# Altium project ESP32-S3_6-Channel_Relay_Controller.PrjPcb
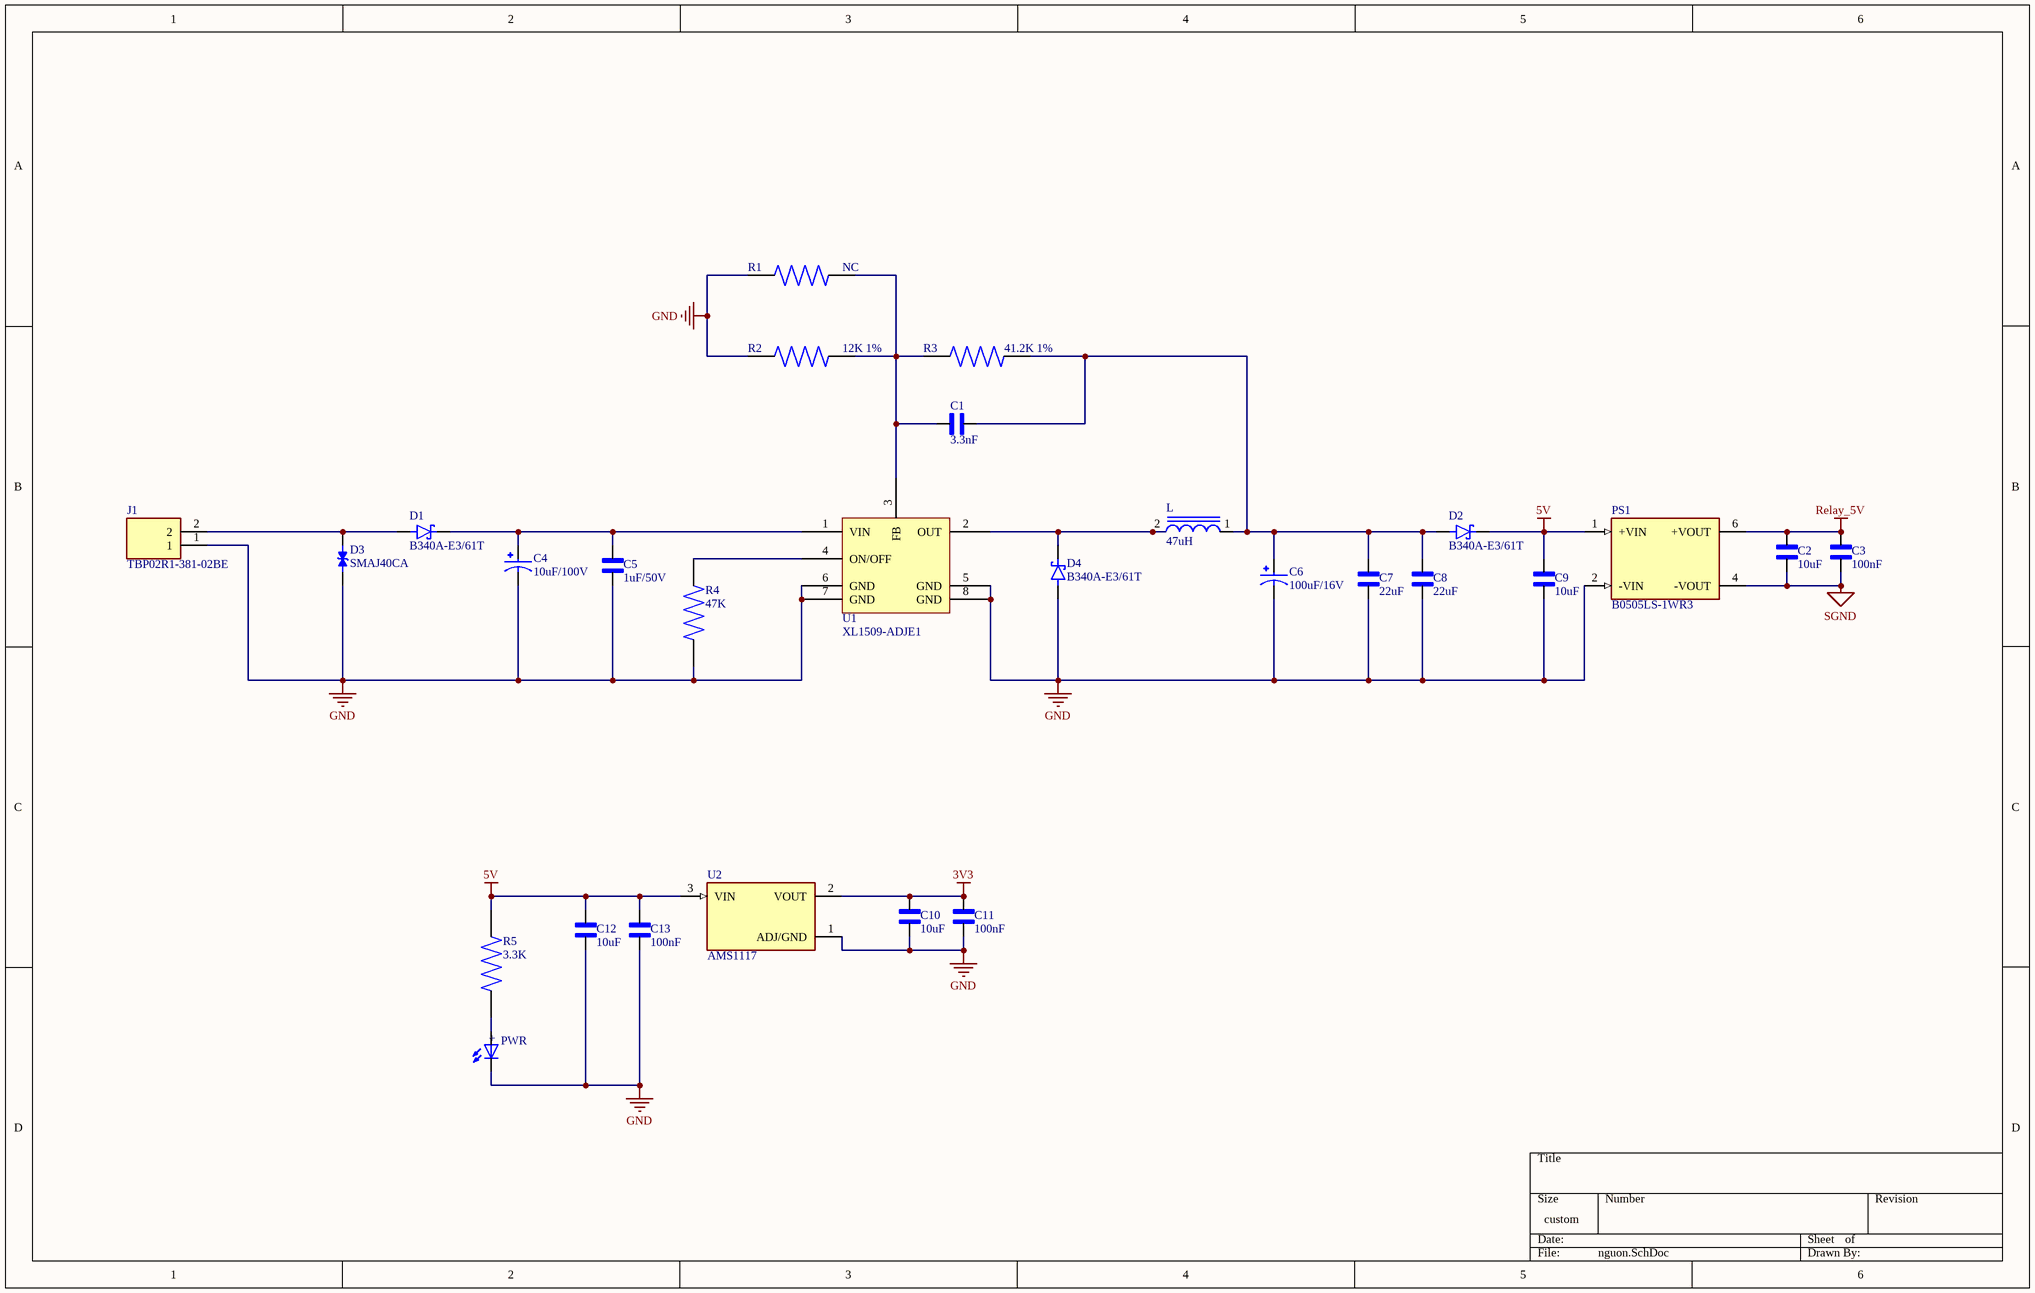
[diagram p0: nguon.SchDoc]
5 sheets, 173 parts. Net scope: global (net labels, ports and power ports of the same name join across sheets).
Board file: esp32s3.PcbDoc
Sheets:
  nguon.SchDoc
  vi_dieu_khien.SchDoc
  RS_485.SchDoc
  Relay.SchDoc
  LoRa.SchDoc

## Sheet nguon.SchDoc
size 381 x 241 mm; SheetNumber: 1; SheetTotal: 5

### Parts
C1  3.3nF  [CAPC1608X94N]
C2  10uF  [CAPC1608X94N]
C3  100nF  [CAPC1608X94N]
C4  10uF/100V  [CAP_EEEFN2A100P]
C5  1uF/50V  [CAPC1608X94N]
C6  100uF/16V  [CAP_EEETC1C101XV]
C7  22uF  [CAPC1608X94N]
C8  22uF  [CAPC1608X94N]
C9  10uF  [CAPC1608X94N]
C10  10uF  [CAPC1608X94N]
C11  100nF  [CAPC1608X94N]
C12  10uF  [CAPC1608X94N]
C13  100nF  [CAPC1608X94N]
D1  B340A-E3/61T  [DIOM5126X229N]
D2  B340A-E3/61T  [DIOM5126X229N]
D3  SMAJ40CA  [DIOM4325X250N]
D4  B340A-E3/61T  [DIOM5126X229N]
J1  TBP02R1-381-02BE  [CUI_TBP02R1-381-02BE]
L  47uH  [Introdutor_47uH_12x12x7]
PS1  B0505LS-1WR3  [CONV_RFB-0505S]
PWR  WL-SMCW_1206  [WL-SMCW_1206]  (value not drawn)
R1  NC  [RES_ERJU03J474V]
R2  12K 1%  [RES_ERJU03J474V]
R3  41.2K 1%  [RES_ERJU03J474V]
R4  47K  [RES_ERJU03J474V]
R5  3.3K  [RES_ERJU03J474V]
U1  XL1509-ADJE1  [SOIC127P599X175-8N]
U2  AMS1117  [SOT229P700X180-4N]

### Nets
3V3: C10.2 C11.2 U2.2(VOUT)
5V: C9.2 C12.2 C13.2 D2.C PS1.1(+VIN) R5.2 U2.3(VIN)
GND: C4.2 C5.1 C6.2 C7.1 C8.1 C9.1 C10.1 C11.1 C12.1 C13.1 D3.1 D4.A J1.1 PS1.2(-VIN) PWR.1(NEG) R1.2 R2.2 R4.1 U1.5(GND) U1.6(GND) U1.7(GND) U1.8(GND) U2.1(ADJ/GND)
Relay_5V: C2.2 C3.2 PS1.6(+VOUT)
SGND: C2.1 C3.1 PS1.4(-VOUT)
NetC1_1: C1.1 C6.1 C7.2 C8.2 D2.A L.1 R3.1
NetC1_2: C1.2 R1.1 R2.1 R3.2 U1.3(FB)
NetC4_1: C4.1 C5.2 D1.C U1.1(VIN)
NetD1_A: D1.A D3.2 J1.2
NetD4_C: D4.C L.2 U1.2(OUT)
NetPWR_2: PWR.2(POS) R5.1
NetR4_2: R4.2 U1.4(ON/OFF)

### Notes on the sheet
- (in symbol WL-SMCW_1206) +

### Library data of the parts
C1-C3 C5 C7-C13 = cap_0603_VJ0603D3R9DXCAP: cap 0603 (1608 Metric); MF: Vishay Vitramon; SnapEDA_Link: https://www.snapeda.com/parts/VJ0603D3R9DXCAP/Vishay/view-part/?ref=snap; Package: 1608 Vishay Vitramon; Value: *; MP: VJ0603D3R9DXCAP; Check_prices: https://www.snapeda.com/parts/VJ0603D3R9DXCAP/Vishay/view-part/?ref=eda
C4 = EEEFN2A100P: CAP ALUM 10UF 20% 100V SMD; MF: Panasonic; SnapEDA_Link: https://www.snapeda.com/parts/EEEFN2A100P/Panasonic/view-part/?ref=snap; Package: RADIAL-2 Panasonic; Value: *; MP: EEEFN2A100P; Check_prices: https://www.snapeda.com/parts/EEEFN2A100P/Panasonic/view-part/?ref=eda
C6 = EEETC1C101XV: CAP ALUM 100UF 20% 16V SMD; MF: Panasonic; Package: RADIAL-2 Panasonic; Price: None; Check_prices: https://www.snapeda.com/parts/EEETC1C101XV/Panasonic/view-part/?ref=eda; Value: *; SnapEDA_Link: https://www.snapeda.com/parts/EEETC1C101XV/Panasonic/view-part/?ref=snap; MP: EEETC1C101XV; Availability: In Stock; Purchase-URL: https://pricing.snapeda.com/search/part/EEETC1C101XV/?ref=eda
D1 D2 D4 = B340A-E3/61T: Diode Schottky 40 V 3A Surface Mount DO-214AC (SMA); MF: Vishay Semiconductor; SnapEDA_Link: https://www.snapeda.com/parts/B340A-E3/61T/Vishay/view-part/?ref=snap; Package: DO-214 Vishay Semiconductor; Value: *; MP: B340A-E3/61T; Check_prices: https://www.snapeda.com/parts/B340A-E3/61T/Vishay/view-part/?ref=eda
D3 = SMAJ40CA: Transient Voltage Suppressor, TVS, Transil SMAJ Series, Bidirectional, 40 V, DO-214AC, 2, 44.4 V; MF: STMicroelectronics; MP: SMAJ40CA-TR; SnapEDA_Link: https://www.snapeda.com/parts/SMAJ40CA-TR/STMicroelectronics/view-part/?ref=snap; Package: DO-214 STMicroelectronics; Value: *; Check_prices: https://www.snapeda.com/parts/SMAJ40CA-TR/STMicroelectronics/view-part/?ref=eda
J1 = TBP02R1-381-02BE: 2~24 Poles, Pluggable,Receptacle, Horizontal, 3.81 Pitch, Terminal Block Connector; MF: Same Sky; SnapEDA_Link: https://www.snapeda.com/parts/TBP02R1-381-02BE/Same+Sky/view-part/?ref=snap; Package: None; Value: *; MP: TBP02R1-381-02BE; Check_prices: https://www.snapeda.com/parts/TBP02R1-381-02BE/Same+Sky/view-part/?ref=eda
L = Introdutor_47uH_12x12x7SRR1260-470M: 47ÂµH Shielded Wirewound Inductor 2.6A 86mOhm Max Nonstandard; MF: Bourns; Value: *; Package: Nonstandard Bourns; Price: None; SnapEDA_Link: https://www.snapeda.com/parts/SRR1260-470M/Bourns/view-part/283129/?ref=snap; Availability: Unavailable; MP: SRR1260-470M
PS1 = B0505LS-1WR3: 1W DC/DC-Converter 'ECONOLINE' SIP7 1kV unreg; MF: Recom Power; MP: RFB-0505S; SnapEDA_Link: https://www.snapeda.com/parts/RFB-0505S/Recom+Power/view-part/?ref=snap; Package: SIP-6 Recom Power; Value: *; Check_prices: https://www.snapeda.com/parts/RFB-0505S/Recom+Power/view-part/?ref=eda
PWR = WL-SMCW_1206: 1206, Blue Typ.(@20mA): 470nm, 145mcd, 3.2V, 140Â° InGaN; MF: Wurth Electronics; MP: 150120BS75000; SnapEDA_Link: https://www.snapeda.com/parts/150120BS75000/Wurth+Electronics/view-part/?ref=snap; Package: 1206 Wurth Electronics; Value: *; Check_prices: https://www.snapeda.com/parts/150120BS75000/Wurth+Electronics/view-part/?ref=eda
R1-R5 = res_0603_ERJU03J474V: 0603 Anti-Sulfurated; MF: Panasonic; SnapEDA_Link: https://www.snapeda.com/parts/ERJU03J474V/Panasonic/view-part/?ref=snap; Package: 1608-2 Panasonic; Value: *; MP: ERJU03J474V; Check_prices: https://www.snapeda.com/parts/ERJU03J474V/Panasonic/view-part/?ref=eda
U1 = XL1509-ADJE1: 2A 150KHz 40V Buck DC to DC Converter; MF: Texas Instruments; MP: LM358DR; SnapEDA_Link: https://www.snapeda.com/parts/LM358DR/Texas+Instruments/view-part/?ref=snap; Package: SOIC-8 Texas Instruments; Value: *; Check_prices: https://www.snapeda.com/parts/LM358DR/Texas+Instruments/view-part/?ref=eda
U2 = AMS1117: 1A LOW DROPOUT VOLTAGE REGULATOR SOT-223; MF: Advanced Monolithic Systems; SnapEDA_Link: https://www.snapeda.com/parts/AMS1117/Advanced+Monolithic+Systems/view-part/?ref=snap; Package: SOT-223 Seeed Technology; Value: *; MP: AMS1117; Check_prices: https://www.snapeda.com/parts/AMS1117/Advanced+Monolithic+Systems/view-part/?ref=eda

## Sheet vi_dieu_khien.SchDoc
size C; SheetNumber: 2; SheetTotal: 5
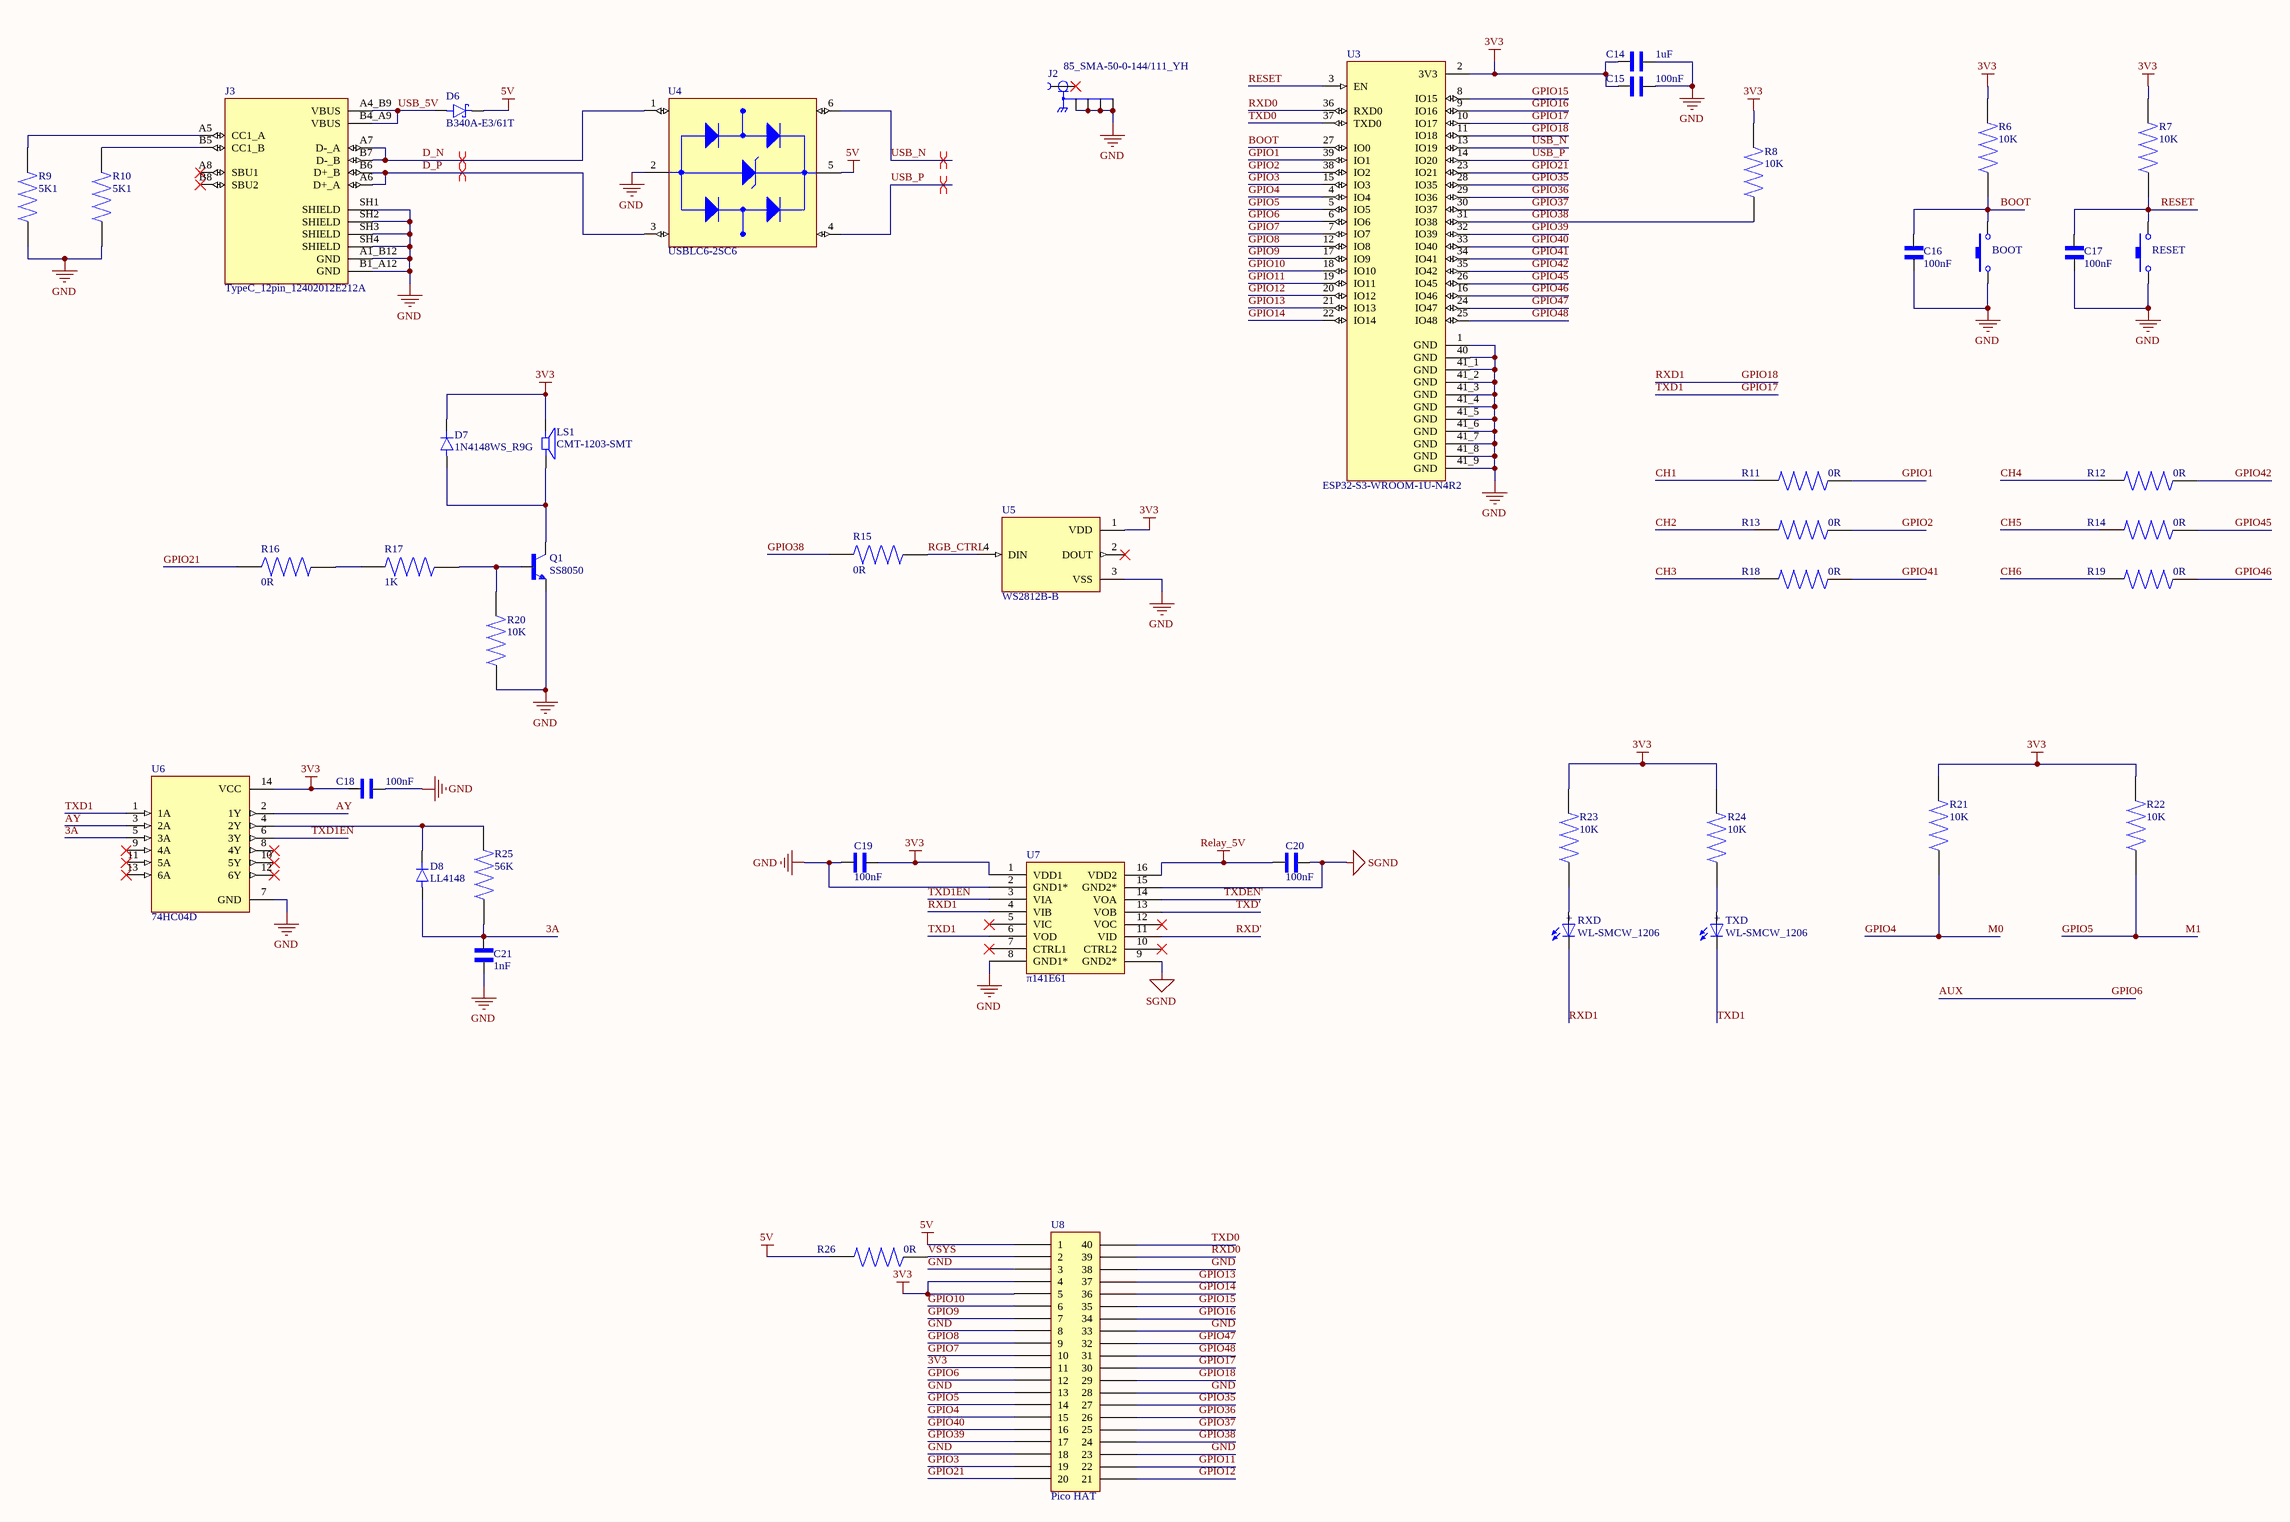
[diagram p1: vi_dieu_khien.SchDoc]

### Parts
BOOT  Nut Nhan 2 Chan SMD 3x6x2.5  [PCBComponent_1]  (value not drawn)
C14  1uF  [CAPC1608X94N]
C15  100nF  [CAPC1608X94N]
C16  100nF  [CAPC1608X94N]
C17  100nF  [CAPC1608X94N]
C18  100nF  [CAPC1608X94N]
C19  100nF  [CAPC1608X94N]
C20  100nF  [CAPC1608X94N]
C21  1nF  [CAPC1608X94N]
D6  B340A-E3/61T  [DIOM5126X229N]
D7  1N4148WS_R9G  [DIO_1N4148WS_R9G]
D8  LL4148  [DIO_LL4148]
J2  85_SMA-50-0-144/111_YH  [HUBER+SUHNER_85_SMA-50-0-144/111_YH]
J3  TypeC_12pin_12402012E212A  [TypeC_12pin_12402012E212A]
LS1  CMT-1203-SMT  [CUI_CMT-1203-SMT]
Q1  SS8050  [SOT-23_BEC]
R6  10K  [RES_ERJU03J474V]
R7  10K  [RES_ERJU03J474V]
R8  10K  [RES_ERJU03J474V]
R9  5K1  [RES_ERJU03J474V]
R10  5K1  [RES_ERJU03J474V]
R11  0R  [RES_ERJU03J474V]
R12  0R  [RES_ERJU03J474V]
R13  0R  [RES_ERJU03J474V]
R14  0R  [RES_ERJU03J474V]
R15  0R  [RES_ERJU03J474V]
R16  0R  [RES_ERJU03J474V]
R17  1K  [RES_ERJU03J474V]
R18  0R  [RES_ERJU03J474V]
R19  0R  [RES_ERJU03J474V]
R20  10K  [RES_ERJU03J474V]
R21  10K  [RES_ERJU03J474V]
R22  10K  [RES_ERJU03J474V]
R23  10K  [RES_ERJU03J474V]
R24  10K  [RES_ERJU03J474V]
R25  56K  [RES_ERJU03J474V]
R26  0R  [RES_ERJU03J474V]
RESET  Nut Nhan 2 Chan SMD 3x6x2.5  [PCBComponent_1]  (value not drawn)
RXD  WL-SMCW_1206  [WL-SMCW_1206]
TXD  WL-SMCW_1206  [WL-SMCW_1206]
U3  ESP32-S3-WROOM-1U-N4R2  [XCVR_ESP32-S3-WROOM-1U-N4R2]
U4  USBLC6-2SC6  [USBLC6-2SC6]
U5  WS2812B-B  [LED_WS2812B-B]
U6  74HC04D  [SOP127P600X170-14N]
U7  π141E61  [SOIC127P1032X265-16N]
U8  Pico HAT  [Pico_HAT]

### Nets
3V3: C14.1 C15.1 C18.1 C19.1 D7.C(K) LS1.1 R6.2 R7.2 R8.2 R21.2 R22.2 R23.2 R24.2 U3.2(3V3) U5.1(VDD) U6.14(VCC) U7.1(VDD1) U8.4 U8.5 U8.11
5V: D6.C R26.2 U4.5(VBUS) U8.1
GND: BOOT.1 C14.2 C15.2 C16.1 C17.1 C18.2 C19.2 C21.1 J2.G1 J2.G2 J2.G3 J2.G4 J3.A1_B12(GND) J3.B1_A12(GND) J3.SH1(SHIELD) J3.SH2(SHIELD) J3.SH3(SHIELD) J3.SH4(SHIELD) Q1.E R9.1 R10.1 R20.1 RESET.1 U3.1(GND) U3.40(GND) U3.41_1(GND) U3.41_2(GND) U3.41_3(GND) U3.41_4(GND) U3.41_5(GND) U3.41_6(GND) U3.41_7(GND) U3.41_8(GND) U3.41_9(GND) U4.2(GND) U5.3(VSS) U6.7(GND) U7.2(GND1*) U7.8(GND1*) U8.3 U8.8 U8.13 U8.18 U8.23 U8.28 U8.33 U8.38
Relay_5V: C20.2 U7.16(VDD2)
SGND: C20.1 U7.9(GND2*) U7.15(GND2*)
3A: C21.2 D8.A R25.1 U6.5(3A)
AUX: U3.6(IO6) U8.12  [also labelled GPIO6]
AY: U6.2(1Y) U6.3(2A)
BOOT: BOOT.2 C16.2 R6.1 U3.27(IO0)
CH1: R11.2
CH2: R13.2
CH3: R18.2
CH4: R12.2
CH5: R14.2
CH6: R19.2
D_N: J3.A7(D-_A) J3.B7(D-_B) U4.1(I/O1_IN)
D_P: J3.A6(D+_A) J3.B6(D+_B) U4.3(I/O2_IN)
GPIO1: R11.1 U3.39(IO1)
GPIO2: R13.1 U3.38(IO2)
GPIO3: U3.15(IO3) U8.19
GPIO4: R21.1 U3.4(IO4) U8.15  [also labelled M0]
GPIO5: R22.1 U3.5(IO5) U8.14  [also labelled M1]
GPIO7: U3.7(IO7) U8.10
GPIO8: U3.12(IO8) U8.9
GPIO9: U3.17(IO9) U8.7
GPIO10: U3.18(IO10) U8.6
GPIO11: U3.19(IO11) U8.22
GPIO12: U3.20(IO12) U8.21
GPIO13: U3.21(IO13) U8.37
GPIO14: U3.22(IO14) U8.36
GPIO15: U3.8(IO15) U8.35
GPIO16: U3.9(IO16) U8.34
GPIO17: TXD.1(NEG) U3.10(IO17) U6.1(1A) U7.6(VOD) U8.30  [also labelled TXD1]
GPIO18: RXD.1(NEG) U3.11(IO18) U7.4(VIB) U8.29  [also labelled RXD1]
GPIO21: R16.1 U3.23(IO21) U8.20
GPIO35: U3.28(IO35) U8.27
GPIO36: U3.29(IO36) U8.26
GPIO37: U3.30(IO37) U8.25
GPIO38: R8.1 R15.1 U3.31(IO38) U8.24
GPIO39: U3.32(IO39) U8.17
GPIO40: U3.33(IO40) U8.16
GPIO41: R18.1 U3.34(IO41)
GPIO42: R12.1 U3.35(IO42)
GPIO45: R14.1 U3.26(IO45)
GPIO46: R19.1 U3.16(IO46)
GPIO47: U3.24(IO47) U8.32
GPIO48: U3.25(IO48) U8.31
RESET: C17.2 R7.1 RESET.2 U3.3(EN)
RGB_CTRL: R15.2 U5.4(DIN)
RXD0: U3.36(RXD0) U8.39
RXD': U7.11(VID)
TXD0: U3.37(TXD0) U8.40
TXD1EN: U6.6(3Y) U7.3(VIA)
TXD': U7.13(VOB)
TXDEN': U7.14(VOA)
USB_5V: D6.A J3.A4_B9(VBUS) J3.B4_A9(VBUS)
USB_N: U3.13(IO19) U4.6(I/O1_OUT)
USB_P: U3.14(IO20) U4.4(I/O2_OUT)
VSYS: R26.1 U8.2
NetD7_A: D7.A LS1.2 Q1.C
NetD8_C: D8.C R25.2 U6.4(2Y)
NetJ3_A5: J3.A5(CC1_A) R9.2
NetJ3_B5: J3.B5(CC1_B) R10.2
NetQ1_B: Q1.B R17.2 R20.2
NetR16_2: R16.2 R17.1
NetR23_1: R23.1 RXD.2(POS)
NetR24_1: R24.1 TXD.2(POS)

Not connected (* = marked no-connect by the designer): J2 1*; J3 A8(SBU1)* B8(SBU2)*; U5 2(DOUT)*; U6 8(4Y)* 9(4A)* 10(5Y)* 11(5A)* 12(6Y)* 13(6A)*; U7 5(VIC)* 7(CTRL1)* 10(CTRL2)* 12(VOC)*

### Layout directives
differential pair: D_N, D_P, USB_N, USB_P

### Notes on the sheet
- (in symbol WL-SMCW_1206) +

### Library data of the parts
BOOT RESET = Nut Nhan 2 Chan SMD 3x6x2.5: Ma_Hang: MH001036; Ten: Nút Nhấn 2 Chân 3x6x2.5MM SMD
C14-C21 = cap_0603_VJ0603D3R9DXCAP: as C1 on sheet nguon; SnapEDA_Link: https://www.snapeda.com/parts/VJ0603D3R9DXCAP/Vishay/view-part/?ref=snap; Package: 1608 Vishay Vitramon; Value: *; MP: VJ0603D3R9DXCAP; Check_prices: https://www.snapeda.com/parts/VJ0603D3R9DXCAP/Vishay/view-part/?ref=eda
D6 = B340A-E3/61T: as D1 on sheet nguon; SnapEDA_Link: https://www.snapeda.com/parts/B340A-E3/61T/Vishay/view-part/?ref=snap; Package: DO-214 Vishay Semiconductor; Value: *; MP: B340A-E3/61T; Check_prices: https://www.snapeda.com/parts/B340A-E3/61T/Vishay/view-part/?ref=eda
D7 = 1N4148WS_R9G: 150mA, 100V High Speed SMD Switching Diode; MF: Taiwan Semiconductor; MP: 1N4148WS R9G; SnapEDA_Link: https://www.snapeda.com/parts/1N4148WS%20R9G/Taiwan+Semiconductor/view-part/?ref=snap; Package: SOD-323F Taiwan Semiconductor; Value: *; Check_prices: https://www.snapeda.com/parts/1N4148WS%20R9G/Taiwan+Semiconductor/view-part/?ref=eda
D8 = LL4148: Small Signal Diode, SOD-80, 100V, 0.15A, 175Â°C; MF: Diotec Semiconductor; SnapEDA_Link: https://www.snapeda.com/parts/LL4148/Diotec/view-part/?ref=snap; Package: SOD-80 Diotec; Value: *; MP: LL4148; Check_prices: https://www.snapeda.com/parts/LL4148/Diotec/view-part/?ref=eda
J2 = 85_SMA-50-0-144/111_YH: RF Connector, SMA Right angle PCB jack(f) | HUBER+SUHNER 85_SMA-50-0-144/111_YH; SnapEDA_Link: https://www.snapeda.com/parts/85_SMA-50-0-144/111_YH/Huber%252BSuhner/view-part/?ref=snap; Package: None; Value: *; MF: HUBER+SUHNER; MP: 85_SMA-50-0-144/111_YH; Check_prices: https://www.snapeda.com/parts/85_SMA-50-0-144/111_YH/Huber%252BSuhner/view-part/?ref=eda
J3 = TypeC_12pin_12402012E212A: USB2.0, Type C, Top mount, CH 1.68mm, Dual Row SMT; MF: Amphenol ICC (Commercial Products); MP: 12402012E212A; Price: None; Package: None; Availability: In Stock; SnapEDA_Link: https://www.snapeda.com/parts/12402012E212A/Amphenol/view-part/?ref=snap; Value: *; Check_prices: https://www.snapeda.com/parts/12402012E212A/Amphenol/view-part/?ref=eda; Purchase-URL: https://pricing.snapeda.com/search/part/12402012E212A/?ref=eda
LS1 = CMT-1203-SMT: 12 mm, 25 V, 81 dB, Surface Mount (SMT), Piezo Audio Transducer Buzzer; MF: Same Sky; MP: CMT-1203-SMT-TR; SnapEDA_Link: https://www.snapeda.com/parts/CMT-1203-SMT-TR/Same+Sky/view-part/?ref=snap; Package: CUI Inc.; Value: *; Check_prices: https://www.snapeda.com/parts/CMT-1203-SMT-TR/Same+Sky/view-part/?ref=eda
Q1 = SS8050: NPN Epitaxial Silicon Transistor; MF: ON Semiconductor / Fairchild; SnapEDA_Link: https://www.snapeda.com/parts/SS8050/Fairchild+Semiconductor/view-part/?ref=snap; Package: TO-92-3 ON Semiconductor; Value: *; MP: SS8050; Check_prices: https://www.snapeda.com/parts/SS8050/Fairchild+Semiconductor/view-part/?ref=eda
R6-R26 = res_0603_ERJU03J474V: 0603 Anti-Sulfurated; MF: Panasonic; SnapEDA_Link: https://www.snapeda.com/parts/ERJU03J474V/Panasonic/view-part/?ref=snap; Package: 1608-2 Panasonic; Value: *; MP: ERJU03J474V; Check_prices: https://www.snapeda.com/parts/ERJU03J474V/Panasonic/view-part/?ref=eda
RXD TXD = WL-SMCW_1206: as PWR on sheet nguon; SnapEDA_Link: https://www.snapeda.com/parts/150120BS75000/Wurth+Electronics/view-part/?ref=snap; Package: 1206 Wurth Electronics; Value: *; Check_prices: https://www.snapeda.com/parts/150120BS75000/Wurth+Electronics/view-part/?ref=eda
U3 = ESP32-S3-WROOM-1U-N4R2: MF: {'manufacturer': u'Espressif Systems'}; Package: None; Price: None; Value: *; MP: ESP32-S3-WROOM-1U-N4R2; Availability: Unavailable
U4 = USBLC6-2SC6: 17V Clamp 5A (8/20Âµs) Ipp Tvs Diode Surface Mount SOT-23-6; MF: STMicroelectronics; Value: *; SnapEDA_Link: https://www.snapeda.com/parts/USBLC6-2SC6/STMicroelectronics/view-part/?ref=snap; Check_prices: https://www.snapeda.com/parts/USBLC6-2SC6/STMicroelectronics/view-part/?ref=eda; Purchase-URL: https://pricing.snapeda.com/search/part/USBLC6-2SC6/?ref=eda; Price: None; Availability: In Stock; Package: SOT-23-6 STMicroelectronics; MP: USBLC6-2SC6
U5 = WS2812B-B: Intelligent control LED integrated light source; Availability: Unavailable; Price: None; Package: None; MP: WS2812B-B; Value: *
U6 = 74HC04D: Hex Inverters; MF: TAEJIN; SnapEDA_Link: https://www.snapeda.com/parts/74HC04D/TAEJIN/view-part/?ref=snap; Package: SOP-14 TAEJIN; Value: *; MP: 74HC04D; Check_prices: https://www.snapeda.com/parts/74HC04D/TAEJIN/view-part/?ref=eda
U7 = 141E61: 4-Channel Digital Isolator, 3 Forward/1 Reverse, 5kVrms Isolation, SOIC-16 Wide , (300mil), SMD,π141E61

## Sheet RS_485.SchDoc
size 381 x 241 mm; SheetNumber: 3; SheetTotal: 5
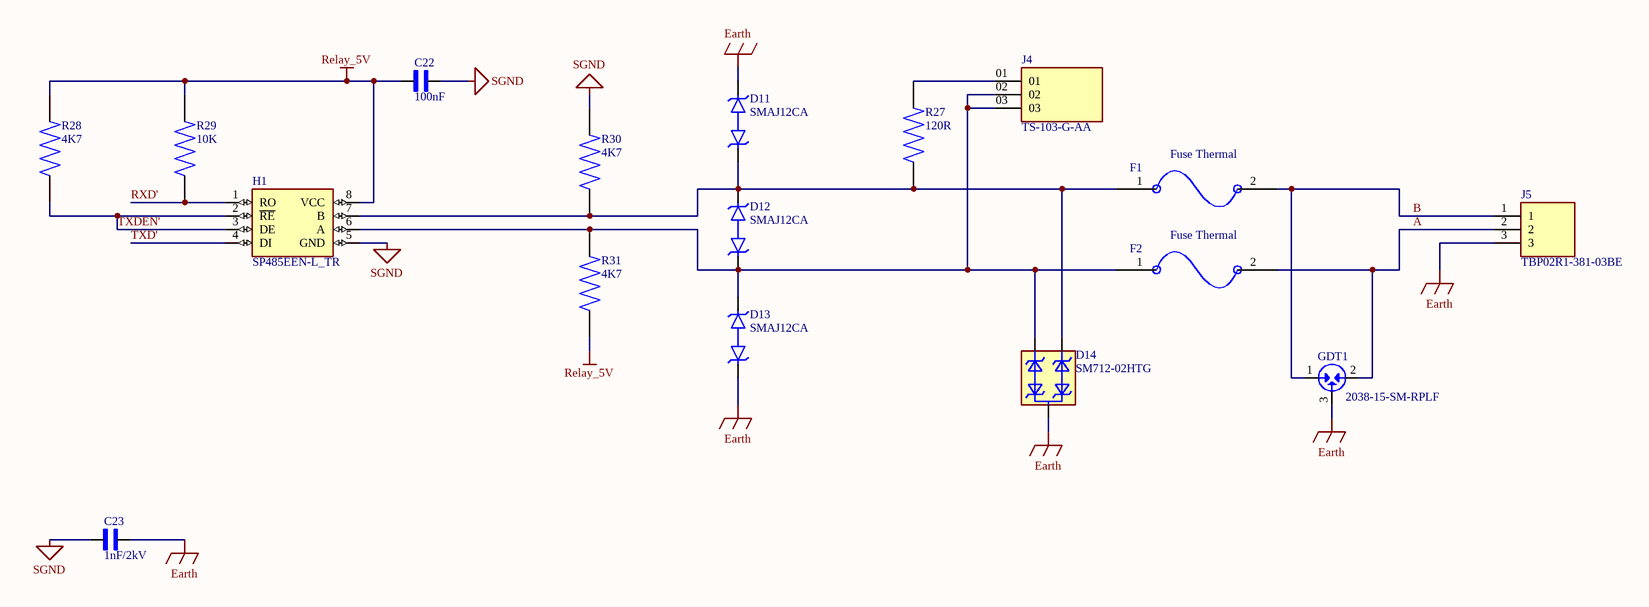
[diagram p2: RS_485.SchDoc]

### Parts
C22  100nF  [CAPC1608X94N]
C23  1nF/2kV  [CAPC4532X155N]
D11  SMAJ12CA  [DIOM5026X229N]
D12  SMAJ12CA  [DIOM5026X229N]
D13  SMAJ12CA  [DIOM5026X229N]
D14  SM712-02HTG  [SOT23]
F1  Fuse Thermal  [RESC3115X65N]
F2  Fuse Thermal  [RESC3115X65N]
GDT1  2038-15-SM-RPLF  [TVS_2031-42T-SM-RPLF]
H1  SP485EEN-L_TR  [SOIC127P600X175-8N]
J4  TS-103-G-AA  [SAMTEC_TS-103-G-AA]
J5  TBP02R1-381-03BE  [CUI_TBP02R1-381-03BE]
R27  120R  [RES_ERJU03J474V]
R28  4K7  [RES_ERJU03J474V]
R29  10K  [RES_ERJU03J474V]
R30  4K7  [RES_ERJU03J474V]
R31  4K7  [RES_ERJU03J474V]

### Nets
Earth: C23.2 D11.2(A) D13.1(K) D14.3 GDT1.3 J5.3
Relay_5V: C22.2 H1.8(VCC) R28.2 R29.2 R31.1
SGND: C22.1 C23.1 H1.5(GND) R30.2
A: F2.2 GDT1.2 J5.2
B: F1.2 GDT1.1 J5.1
RXD': H1.1(RO) R29.1
TXD': H1.4(DI)
TXDEN': H1.2(~{RE}) H1.3(DE) R28.1
NetD11_1: D11.1(K) D12.2(A) D14.1 F1.1 H1.7(B) R27.2 R30.1
NetD12_1: D12.1(K) D13.2(A) D14.2 F2.1 H1.6(A) J4.02 J4.03 R31.2
NetJ4_01: J4.01 R27.1

### Library data of the parts
C22 = cap_0603_VJ0603D3R9DXCAP: as C1 on sheet nguon; SnapEDA_Link: https://www.snapeda.com/parts/VJ0603D3R9DXCAP/Vishay/view-part/?ref=snap; Package: 1608 Vishay Vitramon; Value: *; MP: VJ0603D3R9DXCAP; Check_prices: https://www.snapeda.com/parts/VJ0603D3R9DXCAP/Vishay/view-part/?ref=eda
C23 = C1812C102KGRACAUTO: 1000 pF Â±10% 2000V (2kV) Ceramic Capacitor X7R 1812 (4532 Metric); MF: KEMET; SnapEDA_Link: https://www.snapeda.com/parts/C1812C102KGRACAUTO/KEMET/view-part/?ref=snap; Package: 4532 KEMET; Value: *; MP: C1812C102KGRACAUTO; Check_prices: https://www.snapeda.com/parts/C1812C102KGRACAUTO/KEMET/view-part/?ref=eda
D11-D13 = SMAJ12CA: 19.9V Clamp 20.1A Ipp Tvs Diode Surface Mount SMAJ (DO-214AC); MF: AVX; SnapEDA_Link: https://www.snapeda.com/parts/SMAJ12CA/AVX/view-part/?ref=snap; Package: DO-214 AVX; Value: *; MP: SMAJ12CA; Check_prices: https://www.snapeda.com/parts/SMAJ12CA/AVX/view-part/?ref=eda
D14 = SM712-02HTG: TVS Diode, SM712 Series, 31V Clamp, 600W Peak Pulse, Surface Mount, SOT23-3 | Littelfuse SM712-02HTG; MF: Littelfuse Inc.; SnapEDA_Link: https://www.snapeda.com/parts/SM712-02HTG/Littelfuse/view-part/?ref=snap; Package: SOT-23 Littelfuse Inc.; Value: *; MP: SM712-02HTG; Check_prices: https://www.snapeda.com/parts/SM712-02HTG/Littelfuse/view-part/?ref=eda
F1 F2 = Fuse Thermal: Fuse, Resettable, Fast Acting, 10A, Sz 1206, 0.134x0.071x0.033", SMT, 24VDC, PCB | Bourns MF-NSMF200-2
GDT1 = 2038-15-SM-RPLF: Gas Tube, 3 Electr, 150V, 10kA, 5 mm, SMT, Reel pack, 2038 Series | Bourns 2038-15-SM-RPLF; MP: 2031-42T-SM-RPLF; SnapEDA_Link: https://www.snapeda.com/parts/2031-42T-SM-RPLF/Bourns/view-part/?ref=snap; Package: None; Value: *; MF: Bourns; Check_prices: https://www.snapeda.com/parts/2031-42T-SM-RPLF/Bourns/view-part/?ref=eda
H1 = SP485EEN-L_TR: SP485E Series 10Mbps 5V Enhanced Low EMI Half Duplex RS-485 Transceiver -NSOIC-8; MF: MaxLinear, Inc.; MP: SP485EEN-L/TR; SnapEDA_Link: https://www.snapeda.com/parts/SP485EEN-L/TR/MaxLinear/view-part/?ref=snap; Package: SOIC-8 Exar; Value: *; Check_prices: https://www.snapeda.com/parts/SP485EEN-L/TR/MaxLinear/view-part/?ref=eda
J4 = TS-103-G-AA: Conn Unshrouded Header HDR 3 POS 2.54mm Solder ST Thru-Hole Bulk; MF: Samtec; MP: TS-103-G-AA; Price: None; Purchase-URL: https://pricing.snapeda.com/search/part/TS-103-G-AA/?ref=eda; Package: None; Check_prices: https://www.snapeda.com/parts/TS-103-G-AA/Samtec/view-part/?ref=eda; Value: *; Availability: In Stock; SnapEDA_Link: https://www.snapeda.com/parts/TS-103-G-AA/Samtec/view-part/?ref=snap
J5 = TBP02R1-381-03BE: 2~24 Poles, Pluggable,Receptacle, Horizontal, 3.81 Pitch, Terminal Block Connector; MF: Same Sky; SnapEDA_Link: https://www.snapeda.com/parts/TBP02R1-381-03BE/Same+Sky/view-part/?ref=snap; Package: None; Value: *; MP: TBP02R1-381-03BE; Check_prices: https://www.snapeda.com/parts/TBP02R1-381-03BE/Same+Sky/view-part/?ref=eda
R27-R31 = res_0603_ERJU03J474V: 0603 Anti-Sulfurated; MF: Panasonic; SnapEDA_Link: https://www.snapeda.com/parts/ERJU03J474V/Panasonic/view-part/?ref=snap; Package: 1608-2 Panasonic; Value: *; MP: ERJU03J474V; Check_prices: https://www.snapeda.com/parts/ERJU03J474V/Panasonic/view-part/?ref=eda

## Sheet Relay.SchDoc
size D; SheetNumber: 4; SheetTotal: 5
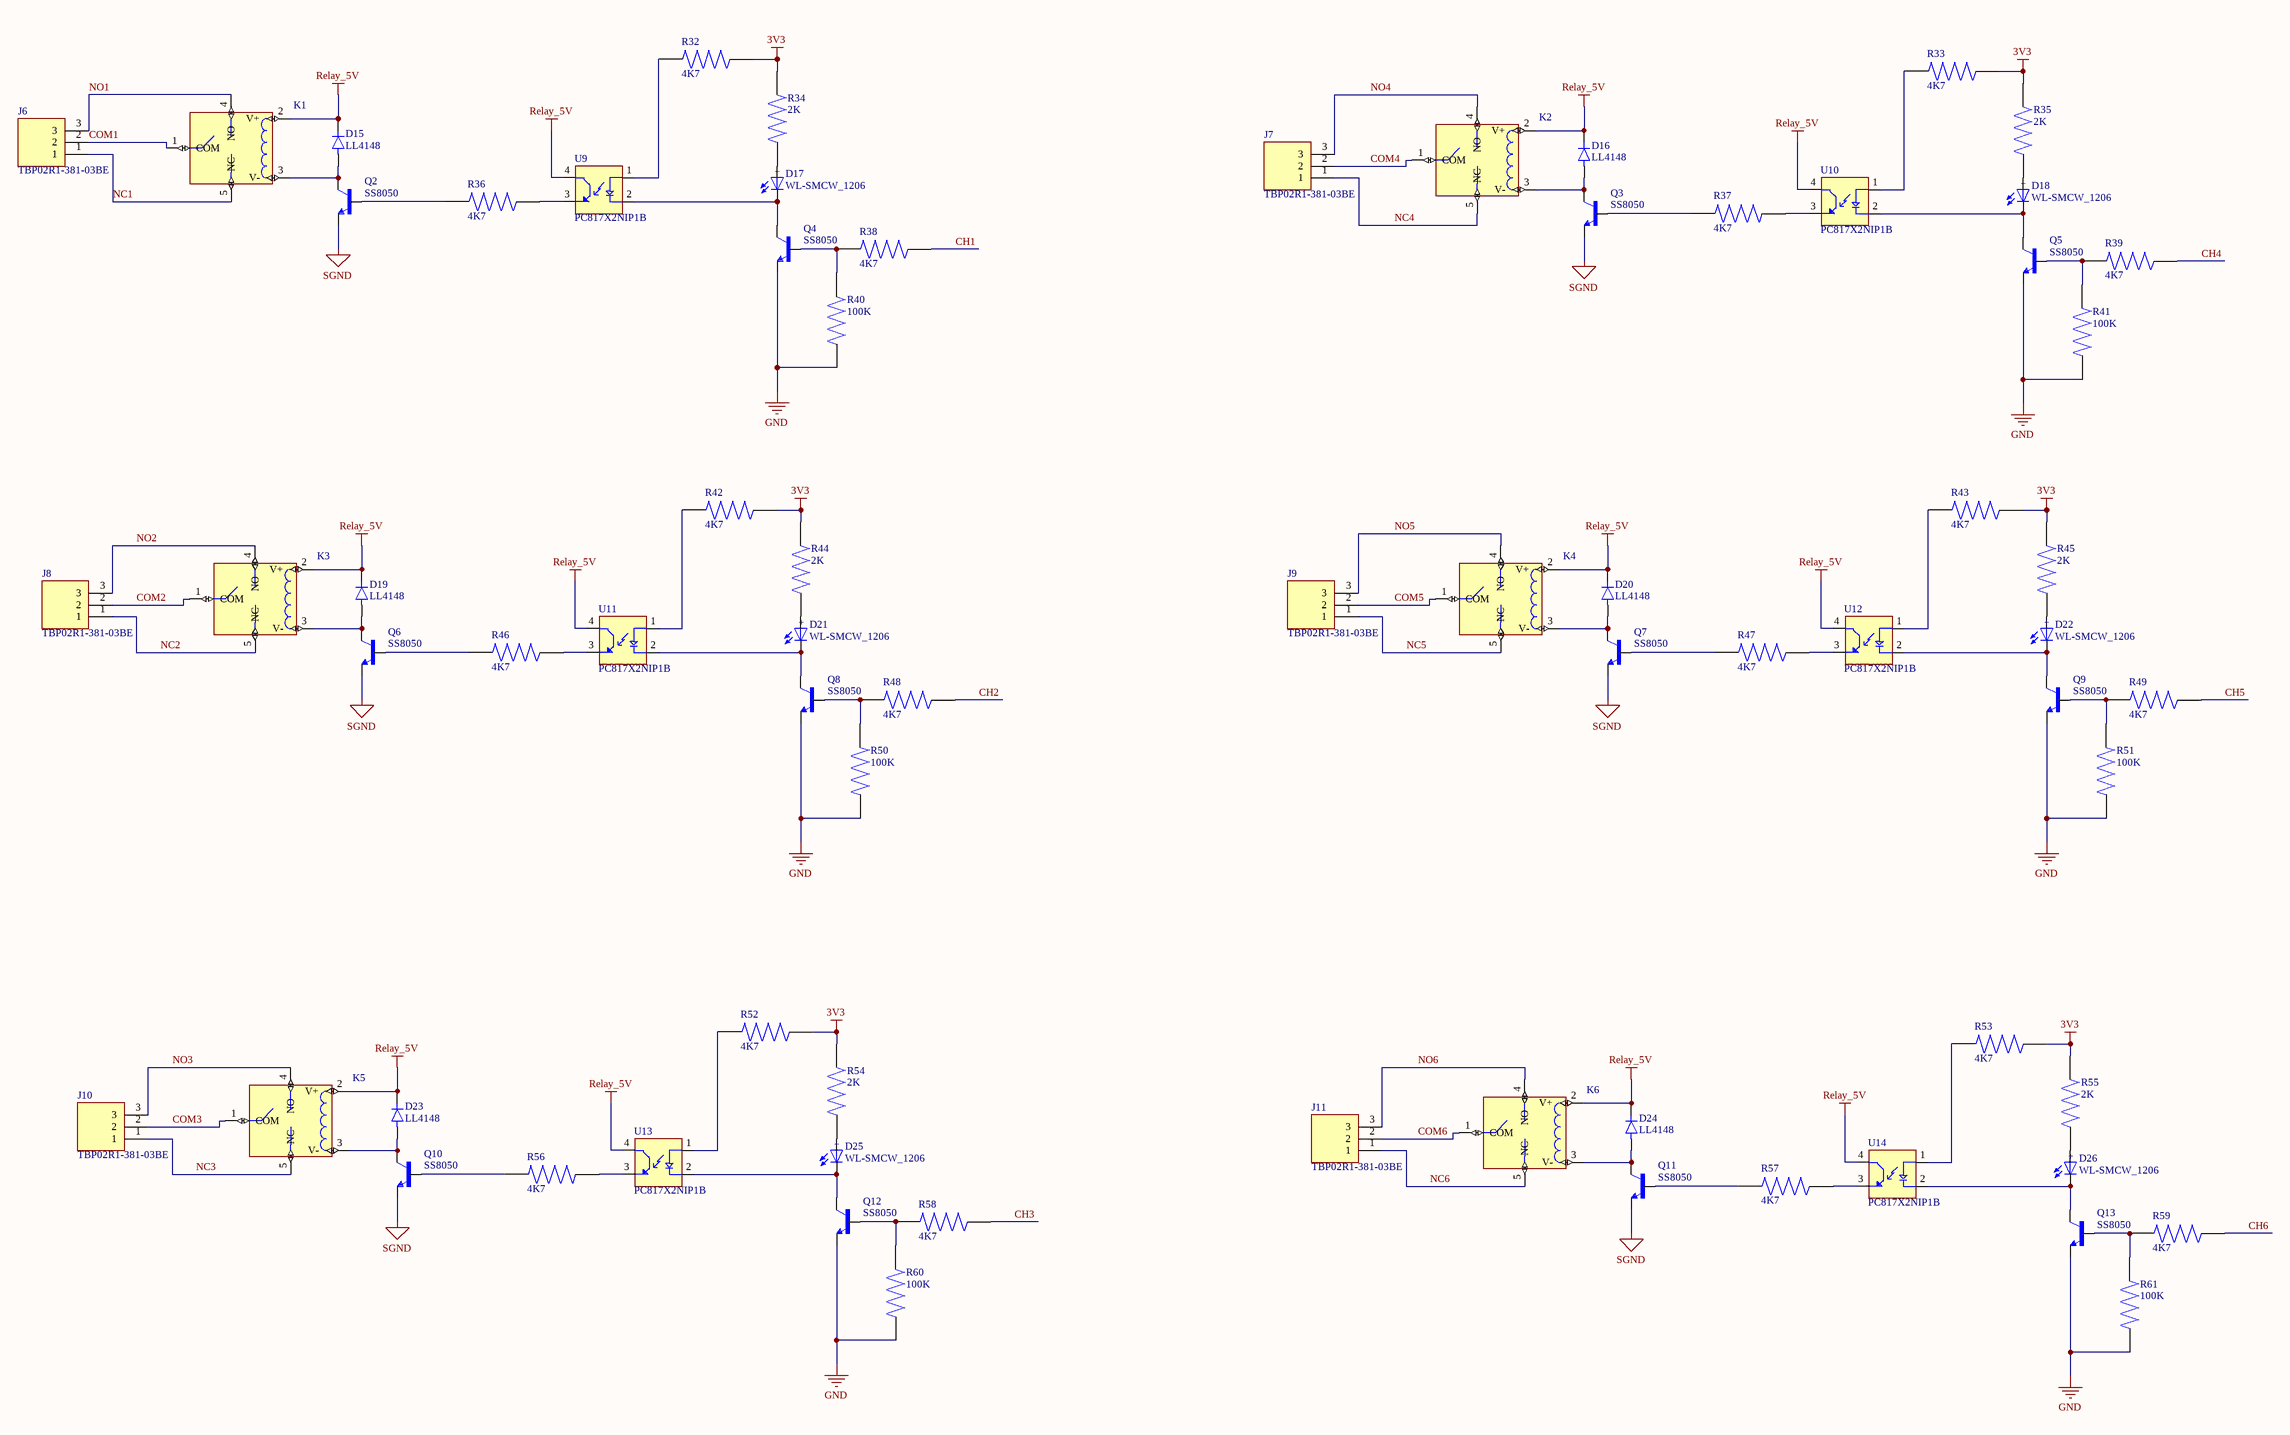
[diagram p3: Relay.SchDoc]

### Parts
D15  LL4148  [DIO_LL4148]
D16  LL4148  [DIO_LL4148]
D17  WL-SMCW_1206  [WL-SMCW_1206]
D18  WL-SMCW_1206  [WL-SMCW_1206]
D19  LL4148  [DIO_LL4148]
D20  LL4148  [DIO_LL4148]
D21  WL-SMCW_1206  [WL-SMCW_1206]
D22  WL-SMCW_1206  [WL-SMCW_1206]
D23  LL4148  [DIO_LL4148]
D24  LL4148  [DIO_LL4148]
D25  WL-SMCW_1206  [WL-SMCW_1206]
D26  WL-SMCW_1206  [WL-SMCW_1206]
J6  TBP02R1-381-03BE  [CUI_TBP02R1-381-03BE]
J7  TBP02R1-381-03BE  [CUI_TBP02R1-381-03BE]
J8  TBP02R1-381-03BE  [CUI_TBP02R1-381-03BE]
J9  TBP02R1-381-03BE  [CUI_TBP02R1-381-03BE]
J10  TBP02R1-381-03BE  [CUI_TBP02R1-381-03BE]
J11  TBP02R1-381-03BE  [CUI_TBP02R1-381-03BE]
K1  RELAY-HLS8L-DC5V-S-C(5P-19X15MM)  [REY5-19.0X15.0X15.0MM]  (value not drawn)
K2  RELAY-HLS8L-DC5V-S-C(5P-19X15MM)  [REY5-19.0X15.0X15.0MM]  (value not drawn)
K3  RELAY-HLS8L-DC5V-S-C(5P-19X15MM)  [REY5-19.0X15.0X15.0MM]  (value not drawn)
K4  RELAY-HLS8L-DC5V-S-C(5P-19X15MM)  [REY5-19.0X15.0X15.0MM]  (value not drawn)
K5  RELAY-HLS8L-DC5V-S-C(5P-19X15MM)  [REY5-19.0X15.0X15.0MM]  (value not drawn)
K6  RELAY-HLS8L-DC5V-S-C(5P-19X15MM)  [REY5-19.0X15.0X15.0MM]  (value not drawn)
Q2  SS8050  [SOT-23_BEC]
Q3  SS8050  [SOT-23_BEC]
Q4  SS8050  [SOT-23_BEC]
Q5  SS8050  [SOT-23_BEC]
Q6  SS8050  [SOT-23_BEC]
Q7  SS8050  [SOT-23_BEC]
Q8  SS8050  [SOT-23_BEC]
Q9  SS8050  [SOT-23_BEC]
Q10  SS8050  [SOT-23_BEC]
Q11  SS8050  [SOT-23_BEC]
Q12  SS8050  [SOT-23_BEC]
Q13  SS8050  [SOT-23_BEC]
R32  4K7  [RES_ERJU03J474V]
R33  4K7  [RES_ERJU03J474V]
R34  2K  [RES_ERJU03J474V]
R35  2K  [RES_ERJU03J474V]
R36  4K7  [RES_ERJU03J474V]
R37  4K7  [RES_ERJU03J474V]
R38  4K7  [RES_ERJU03J474V]
R39  4K7  [RES_ERJU03J474V]
R40  100K  [RES_ERJU03J474V]
R41  100K  [RES_ERJU03J474V]
R42  4K7  [RES_ERJU03J474V]
R43  4K7  [RES_ERJU03J474V]
R44  2K  [RES_ERJU03J474V]
R45  2K  [RES_ERJU03J474V]
R46  4K7  [RES_ERJU03J474V]
R47  4K7  [RES_ERJU03J474V]
R48  4K7  [RES_ERJU03J474V]
R49  4K7  [RES_ERJU03J474V]
R50  100K  [RES_ERJU03J474V]
R51  100K  [RES_ERJU03J474V]
R52  4K7  [RES_ERJU03J474V]
R53  4K7  [RES_ERJU03J474V]
R54  2K  [RES_ERJU03J474V]
R55  2K  [RES_ERJU03J474V]
R56  4K7  [RES_ERJU03J474V]
R57  4K7  [RES_ERJU03J474V]
R58  4K7  [RES_ERJU03J474V]
R59  4K7  [RES_ERJU03J474V]
R60  100K  [RES_ERJU03J474V]
R61  100K  [RES_ERJU03J474V]
U9  PC817X2NIP1B  [SOIC254P960X420-4N]
U10  PC817X2NIP1B  [SOIC254P960X420-4N]
U11  PC817X2NIP1B  [SOIC254P960X420-4N]
U12  PC817X2NIP1B  [SOIC254P960X420-4N]
U13  PC817X2NIP1B  [SOIC254P960X420-4N]
U14  PC817X2NIP1B  [SOIC254P960X420-4N]

### Nets
3V3: R32.1 R33.1 R34.1 R35.1 R42.1 R43.1 R44.1 R45.1 R52.1 R53.1 R54.1 R55.1
GND: Q4.E Q5.E Q8.E Q9.E Q12.E Q13.E R40.2 R41.2 R50.2 R51.2 R60.2 R61.2
Relay_5V: D15.C D16.C D19.C D20.C D23.C D24.C K1.2(V+) K2.2(V+) K3.2(V+) K4.2(V+) K5.2(V+) K6.2(V+) U9.4(CT) U10.4(CT) U11.4(CT) U12.4(CT) U13.4(CT) U14.4(CT)
SGND: Q2.E Q3.E Q6.E Q7.E Q10.E Q11.E
CH1: R38.1
CH2: R48.1
CH3: R58.1
CH4: R39.1
CH5: R49.1
CH6: R59.1
COM1: J6.2 K1.1(COM)
COM2: J8.2 K3.1(COM)
COM3: J10.2 K5.1(COM)
COM4: J7.2 K2.1(COM)
COM5: J9.2 K4.1(COM)
COM6: J11.2 K6.1(COM)
NC1: J6.1 K1.5(NC)
NC2: J8.1 K3.5(NC)
NC3: J10.1 K5.5(NC)
NC4: J7.1 K2.5(NC)
NC5: J9.1 K4.5(NC)
NC6: J11.1 K6.5(NC)
NO1: J6.3 K1.4(NO)
NO2: J8.3 K3.4(NO)
NO3: J10.3 K5.4(NO)
NO4: J7.3 K2.4(NO)
NO5: J9.3 K4.4(NO)
NO6: J11.3 K6.4(NO)
NetD15_A: D15.A K1.3(V-) Q2.C
NetD16_A: D16.A K2.3(V-) Q3.C
NetD17_1: D17.1(NEG) Q4.C U9.2(C)
NetD17_2: D17.2(POS) R34.2
NetD18_1: D18.1(NEG) Q5.C U10.2(C)
NetD18_2: D18.2(POS) R35.2
NetD19_A: D19.A K3.3(V-) Q6.C
NetD20_A: D20.A K4.3(V-) Q7.C
NetD21_1: D21.1(NEG) Q8.C U11.2(C)
NetD21_2: D21.2(POS) R44.2
NetD22_1: D22.1(NEG) Q9.C U12.2(C)
NetD22_2: D22.2(POS) R45.2
NetD23_A: D23.A K5.3(V-) Q10.C
NetD24_A: D24.A K6.3(V-) Q11.C
NetD25_1: D25.1(NEG) Q12.C U13.2(C)
NetD25_2: D25.2(POS) R54.2
NetD26_1: D26.1(NEG) Q13.C U14.2(C)
NetD26_2: D26.2(POS) R55.2
NetQ2_B: Q2.B R36.2
NetQ3_B: Q3.B R37.2
NetQ4_B: Q4.B R38.2 R40.1
NetQ5_B: Q5.B R39.2 R41.1
NetQ6_B: Q6.B R46.2
NetQ7_B: Q7.B R47.2
NetQ8_B: Q8.B R48.2 R50.1
NetQ9_B: Q9.B R49.2 R51.1
NetQ10_B: Q10.B R56.2
NetQ11_B: Q11.B R57.2
NetQ12_B: Q12.B R58.2 R60.1
NetQ13_B: Q13.B R59.2 R61.1
NetR32_2: R32.2 U9.1(A)
NetR33_2: R33.2 U10.1(A)
NetR36_1: R36.1 U9.3(ET)
NetR37_1: R37.1 U10.3(ET)
NetR42_2: R42.2 U11.1(A)
NetR43_2: R43.2 U12.1(A)
NetR46_1: R46.1 U11.3(ET)
NetR47_1: R47.1 U12.3(ET)
NetR52_2: R52.2 U13.1(A)
NetR53_2: R53.2 U14.1(A)
NetR56_1: R56.1 U13.3(ET)
NetR57_1: R57.1 U14.3(ET)

### Notes on the sheet
- (in symbol WL-SMCW_1206) +

### Library data of the parts
D15 D16 D19 D20 D23 D24 = LL4148: as D8 on sheet vi_dieu_khien; SnapEDA_Link: https://www.snapeda.com/parts/LL4148/Diotec/view-part/?ref=snap; Package: SOD-80 Diotec; Value: *; MP: LL4148; Check_prices: https://www.snapeda.com/parts/LL4148/Diotec/view-part/?ref=eda
D17 D18 D21 D22 D25 D26 = WL-SMCW_1206: as PWR on sheet nguon; SnapEDA_Link: https://www.snapeda.com/parts/150120BS75000/Wurth+Electronics/view-part/?ref=snap; Package: 1206 Wurth Electronics; Value: *; Check_prices: https://www.snapeda.com/parts/150120BS75000/Wurth+Electronics/view-part/?ref=eda
J6-J11 = TBP02R1-381-03BE: as J5 on sheet RS_485; SnapEDA_Link: https://www.snapeda.com/parts/TBP02R1-381-03BE/Same+Sky/view-part/?ref=snap; Package: None; Value: *; MP: TBP02R1-381-03BE; Check_prices: https://www.snapeda.com/parts/TBP02R1-381-03BE/Same+Sky/view-part/?ref=eda
K1-K6 = RELAY-HLS8L-DC5V-S-C(5P-19X15MM): DIP Power Relay 5V-7A;; MF: Helishun; SnapEDA_Link: https://www.snapeda.com/parts/HLS8L-DC5V-S-C/Helishun/view-part/?ref=snap; Package: None; Value: *; MP: HLS8L-DC5V-S-C; Check_prices: https://www.snapeda.com/parts/HLS8L-DC5V-S-C/Helishun/view-part/?ref=eda
Q2-Q13 = SS8050: as Q1 on sheet vi_dieu_khien; SnapEDA_Link: https://www.snapeda.com/parts/SS8050/Fairchild+Semiconductor/view-part/?ref=snap; Package: TO-92-3 ON Semiconductor; Value: *; MP: SS8050; Check_prices: https://www.snapeda.com/parts/SS8050/Fairchild+Semiconductor/view-part/?ref=eda
R32-R61 = res_0603_ERJU03J474V: 0603 Anti-Sulfurated; MF: Panasonic; SnapEDA_Link: https://www.snapeda.com/parts/ERJU03J474V/Panasonic/view-part/?ref=snap; Package: 1608-2 Panasonic; Value: *; MP: ERJU03J474V; Check_prices: https://www.snapeda.com/parts/ERJU03J474V/Panasonic/view-part/?ref=eda
U9-U14 = PC817X2NIP1B: Optocoupler DC-IN 1-CH Transistor DC-OUT 4-Pin DIP SMD T/R; MF: Sharp Microelectronics; SnapEDA_Link: https://www.snapeda.com/parts/PC817X2NIP1B/Sharp+Microelectronics/view-part/?ref=snap; Package: SMD-4 Sharp Microelectronics; Value: *; MP: PC817X2NIP1B; Check_prices: https://www.snapeda.com/parts/PC817X2NIP1B/Sharp+Microelectronics/view-part/?ref=eda

## Sheet LoRa.SchDoc
size A; SheetNumber: 5; SheetTotal: 5
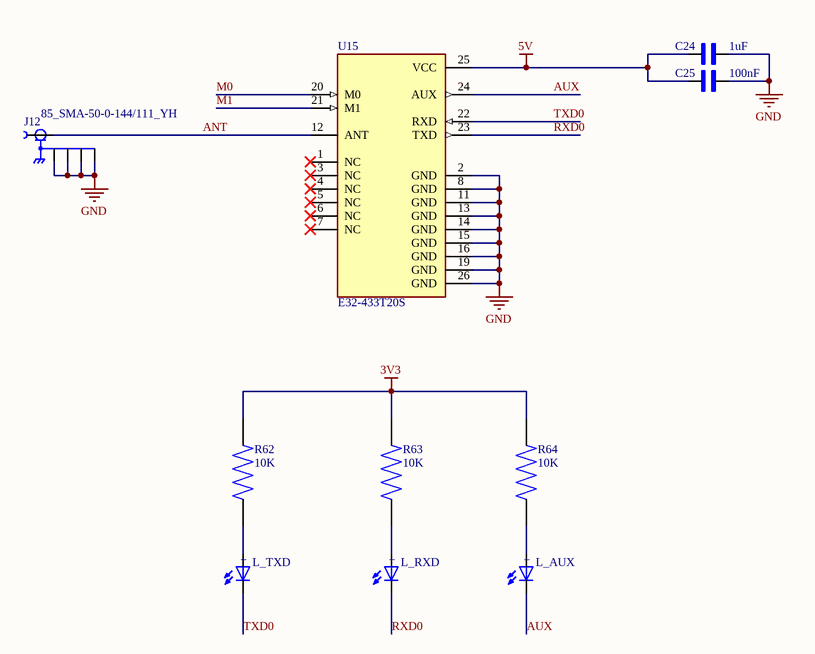
[diagram p4: LoRa.SchDoc]

### Parts
C24  1uF  [CAPC1608X94N]
C25  100nF  [CAPC1608X94N]
J12  85_SMA-50-0-144/111_YH  [HUBER+SUHNER_85_SMA-50-0-144/111_YH]
L_AUX  WL-SMCW_1206  [WL-SMCW_1206]  (value not drawn)
L_RXD  WL-SMCW_1206  [WL-SMCW_1206]  (value not drawn)
L_TXD  WL-SMCW_1206  [WL-SMCW_1206]  (value not drawn)
R62  10K  [RES_ERJU03J474V]
R63  10K  [RES_ERJU03J474V]
R64  10K  [RES_ERJU03J474V]
U15  E32-433T20S  [MODULE_E32-433T20S]

### Nets
3V3: R62.2 R63.2 R64.2
5V: C24.1 C25.1 U15.25(VCC)
GND: C24.2 C25.2 J12.G1 J12.G2 J12.G3 J12.G4 U15.2(GND) U15.8(GND) U15.11(GND) U15.13(GND) U15.14(GND) U15.15(GND) U15.16(GND) U15.19(GND) U15.26(GND)
ANT: J12.1 U15.12(ANT)
AUX: L_AUX.1(NEG) U15.24(AUX)
M0: U15.20(M0)  [project net GPIO4]
M1: U15.21(M1)  [project net GPIO5]
RXD0: L_RXD.1(NEG) U15.23(TXD)
TXD0: L_TXD.1(NEG) U15.22(RXD)
NetL_AUX_2: L_AUX.2(POS) R64.1
NetL_RXD_2: L_RXD.2(POS) R63.1
NetL_TXD_2: L_TXD.2(POS) R62.1

Not connected (* = marked no-connect by the designer): U15 1(NC)* 3(NC)* 4(NC)* 5(NC)* 6(NC)* 7(NC)*

### Notes on the sheet
- (in symbol WL-SMCW_1206) +

### Library data of the parts
C24 C25 = cap_0603_VJ0603D3R9DXCAP: as C1 on sheet nguon; SnapEDA_Link: https://www.snapeda.com/parts/VJ0603D3R9DXCAP/Vishay/view-part/?ref=snap; Package: 1608 Vishay Vitramon; Value: *; MP: VJ0603D3R9DXCAP; Check_prices: https://www.snapeda.com/parts/VJ0603D3R9DXCAP/Vishay/view-part/?ref=eda
J12 = 85_SMA-50-0-144/111_YH: as J2 on sheet vi_dieu_khien; SnapEDA_Link: https://www.snapeda.com/parts/85_SMA-50-0-144/111_YH/Huber%252BSuhner/view-part/?ref=snap; Package: None; Value: *; MF: HUBER+SUHNER; MP: 85_SMA-50-0-144/111_YH; Check_prices: https://www.snapeda.com/parts/85_SMA-50-0-144/111_YH/Huber%252BSuhner/view-part/?ref=eda
L_AUX L_RXD L_TXD = WL-SMCW_1206: as PWR on sheet nguon; SnapEDA_Link: https://www.snapeda.com/parts/150120BS75000/Wurth+Electronics/view-part/?ref=snap; Package: 1206 Wurth Electronics; Value: *; Check_prices: https://www.snapeda.com/parts/150120BS75000/Wurth+Electronics/view-part/?ref=eda
R62-R64 = res_0603_ERJU03J474V: 0603 Anti-Sulfurated; MF: Panasonic; SnapEDA_Link: https://www.snapeda.com/parts/ERJU03J474V/Panasonic/view-part/?ref=snap; Package: 1608-2 Panasonic; Value: *; MP: ERJU03J474V; Check_prices: https://www.snapeda.com/parts/ERJU03J474V/Panasonic/view-part/?ref=eda
U15 = E32-433T20S: Wireless serial port module (UART); MF: EBYTE; Check_prices: https://www.snapeda.com/parts/E32-433T20S/EBYTE/view-part/?ref=eda; Package: Package; MP: E32-433T20S; Value: *; SnapEDA_Link: https://www.snapeda.com/parts/E32-433T20S/EBYTE/view-part/?ref=snap; Price: None; Availability: Not in stock

## Nets that join several sheets
3V3: nguon (C10.2 C11.2 U2.2), vi_dieu_khien (20 pins), Relay (12 pins), LoRa (R62.2 R63.2 R64.2)
5V: nguon (7 pins), vi_dieu_khien (D6.C R26.2 U4.5 U8.1), LoRa (C24.1 C25.1 U15.25)
GND: nguon (23 pins), vi_dieu_khien (47 pins), Relay (12 pins), LoRa (15 pins)
Relay_5V: nguon (C2.2 C3.2 PS1.6), vi_dieu_khien (C20.2 U7.16), RS_485 (5 pins), Relay (18 pins)
SGND: nguon (C2.1 C3.1 PS1.4), vi_dieu_khien (C20.1 U7.9 U7.15), RS_485 (C22.1 C23.1 H1.5 R30.2), Relay (6 pins)
AUX: vi_dieu_khien (U3.6 U8.12), LoRa (L_AUX.1 U15.24)
CH1: vi_dieu_khien (R11.2), Relay (R38.1)
CH2: vi_dieu_khien (R13.2), Relay (R48.1)
CH3: vi_dieu_khien (R18.2), Relay (R58.1)
CH4: vi_dieu_khien (R12.2), Relay (R39.1)
CH5: vi_dieu_khien (R14.2), Relay (R49.1)
CH6: vi_dieu_khien (R19.2), Relay (R59.1)
GPIO4: vi_dieu_khien (R21.1 U3.4 U8.15), LoRa (U15.20)
GPIO5: vi_dieu_khien (R22.1 U3.5 U8.14), LoRa (U15.21)
RXD0: vi_dieu_khien (U3.36 U8.39), LoRa (L_RXD.1 U15.23)
RXD': vi_dieu_khien (U7.11), RS_485 (H1.1 R29.1)
TXD0: vi_dieu_khien (U3.37 U8.40), LoRa (L_TXD.1 U15.22)
TXD': vi_dieu_khien (U7.13), RS_485 (H1.4)
TXDEN': vi_dieu_khien (U7.14), RS_485 (H1.2 H1.3 R28.1)